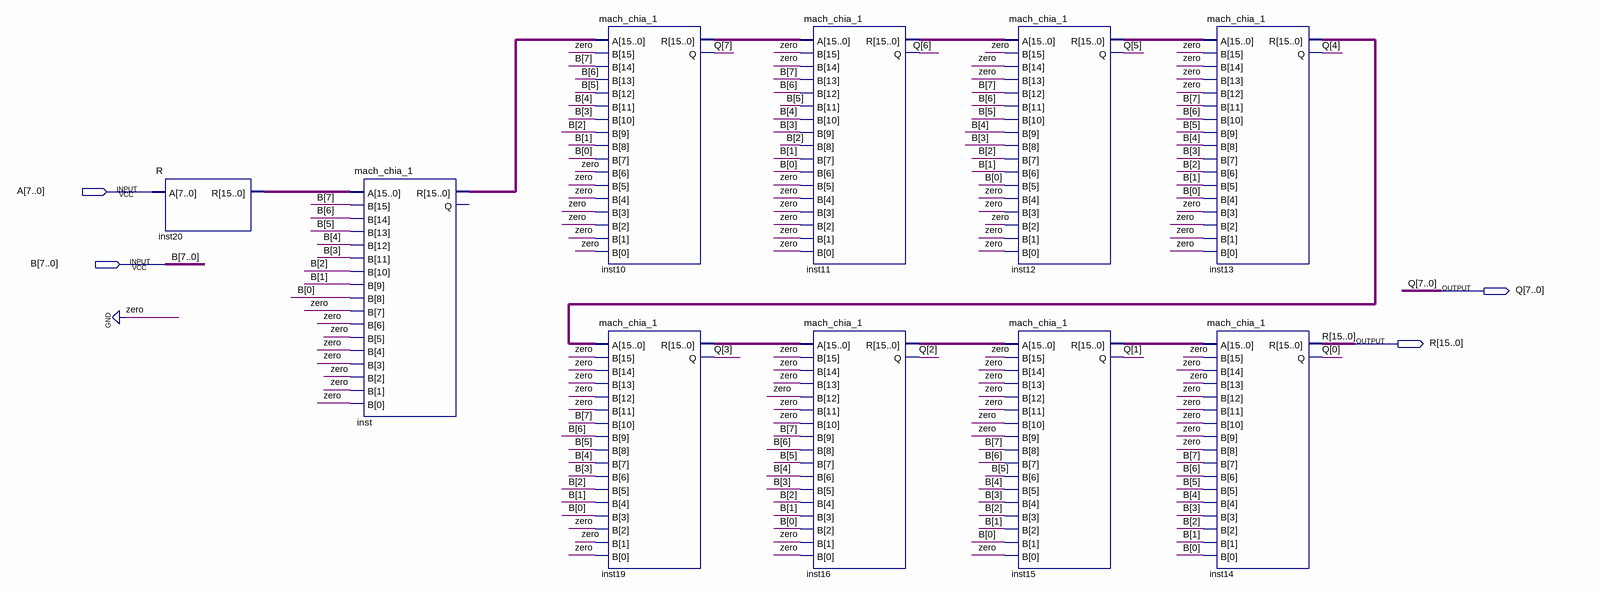
[diagram p0: schematic sheet]
// Quartus schematic mach_chia_cuoi.bdf as structural Verilog: 10 symbols, 4 pins
module mach_chia_cuoi (
  input  [7:0] A,
  input  [7:0] B,
  output [7:0] Q,
  output [15:0] R
);

  wire [15:0] inst10_r, inst11_r, inst12_r, inst13_r, inst15_r, inst16_r, inst19_r, inst20_r, inst_r;

  R inst20 (.A(A), .R(inst20_r));
  mach_chia_1 inst (.A(inst20_r), .B({B, {8{1'b0}}}), .R(inst_r));  // open: Q
  mach_chia_1 inst10 (.A(inst_r), .B({1'b0, B, {7{1'b0}}}), .R(inst10_r), .Q(Q[7]));
  mach_chia_1 inst19 (.A(inst13_r), .B({{5{1'b0}}, B, 3'b000}), .R(inst19_r), .Q(Q[3]));
  mach_chia_1 inst11 (.A(inst10_r), .B({2'b00, B, {6{1'b0}}}), .R(inst11_r), .Q(Q[6]));
  mach_chia_1 inst16 (.A(inst19_r), .B({{6{1'b0}}, B, 2'b00}), .R(inst16_r), .Q(Q[2]));
  mach_chia_1 inst12 (.A(inst11_r), .B({3'b000, B, {5{1'b0}}}), .R(inst12_r), .Q(Q[5]));
  mach_chia_1 inst15 (.A(inst16_r), .B({{7{1'b0}}, B, 1'b0}), .R(inst15_r), .Q(Q[1]));
  mach_chia_1 inst13 (.A(inst12_r), .B({4'b0000, B, 4'b0000}), .R(inst13_r), .Q(Q[4]));
  mach_chia_1 inst14 (.A(inst15_r), .B({{8{1'b0}}, B}), .R(R), .Q(Q[0]));
endmodule
